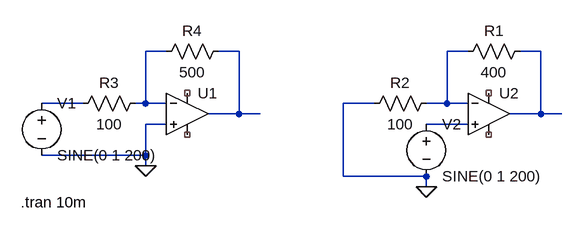
[diagram p0: schematic opamp.asc]
opamp.asc, the LTspice schematic file:
Version 4.1
SHEET 1 880 680
WIRE 128 16 96 16
WIRE 240 16 208 16
WIRE 592 16 560 16
WIRE 704 16 672 16
WIRE 0 96 -64 96
WIRE 96 96 96 16
WIRE 96 96 80 96
WIRE 128 96 96 96
WIRE 448 96 400 96
WIRE 560 96 560 16
WIRE 560 96 528 96
WIRE 592 96 560 96
WIRE 240 112 240 16
WIRE 240 112 192 112
WIRE 272 112 240 112
WIRE 704 112 704 16
WIRE 704 112 656 112
WIRE 736 112 704 112
WIRE 128 128 96 128
WIRE 592 128 528 128
WIRE 96 176 96 128
WIRE 96 176 -64 176
WIRE 96 192 96 176
WIRE 400 208 400 96
WIRE 528 208 400 208
WIRE 528 224 528 208
FLAG 96 192 0
FLAG 528 224 0
SYMBOL OpAmps\\UniversalOpAmp 160 112 R0
SYMATTR InstName U1
SYMBOL OpAmps\\UniversalOpAmp 624 112 R0
SYMATTR InstName U2
SYMBOL voltage -64 80 R0
WINDOW 123 0 0 Left 0
WINDOW 39 0 0 Left 0
SYMATTR InstName V1
SYMATTR Value SINE(0 1 200)
SYMBOL voltage 528 112 R0
WINDOW 123 0 0 Left 0
WINDOW 39 0 0 Left 0
SYMATTR InstName V2
SYMATTR Value SINE(0 1 200)
SYMBOL res 688 0 R90
WINDOW 0 0 56 VBottom 2
WINDOW 3 32 56 VTop 2
SYMATTR InstName R1
SYMATTR Value 400
SYMBOL res 544 80 R90
WINDOW 0 0 56 VBottom 2
WINDOW 3 32 56 VTop 2
SYMATTR InstName R2
SYMATTR Value 100
SYMBOL res 96 80 R90
WINDOW 0 0 56 VBottom 2
WINDOW 3 32 56 VTop 2
SYMATTR InstName R3
SYMATTR Value 100
SYMBOL res 224 0 R90
WINDOW 0 0 56 VBottom 2
WINDOW 3 32 56 VTop 2
SYMATTR InstName R4
SYMATTR Value 500
TEXT -96 248 Left 2 !.tran 10m

The netlist it stands for:
* opamp.asc
X§U1 0 N001 NC_01 NC_02 N002 level1 Avol=1Meg GBW=10Meg Vos=0 En=0 Enk=0 In=0 Ink=0 Rin=500Meg  ; pins In+ In- V+ V- OUT
X§U2 N006 N003 NC_03 NC_04 N004 level1 Avol=1Meg GBW=10Meg Vos=0 En=0 Enk=0 In=0 Ink=0 Rin=500Meg  ; pins In+ In- V+ V- OUT
V1 N005 0 SINE(0 1 200)
V2 N006 0 SINE(0 1 200)
R1 N004 N003 400
R2 N003 0 100
R3 N001 N005 100
R4 N002 N001 500
.tran 10m
.lib UniversalOpAmp1.lib
.backanno
.end